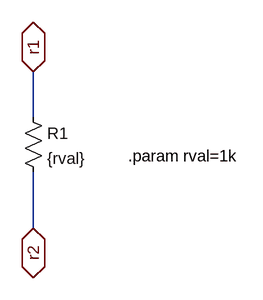
[diagram p0: schematic r_subckt.asc]
r_subckt.asc, the LTspice schematic file:
Version 4.1
SHEET 1 880 680
WIRE 192 112 192 48
WIRE 192 272 192 192
FLAG 192 272 r2
IOPIN 192 272 BiDir
FLAG 192 48 r1
IOPIN 192 48 BiDir
SYMBOL res 176 96 R0
SYMATTR InstName R1
SYMATTR Value {rval}
TEXT 328 168 Left 2 !.param rval=1k

The netlist it stands for:
* r_subckt.asc
R1 r1 r2 {rval}
.param rval=1k
.backanno
.end